# Altium schematic sheet USB.SchDoc
size A4
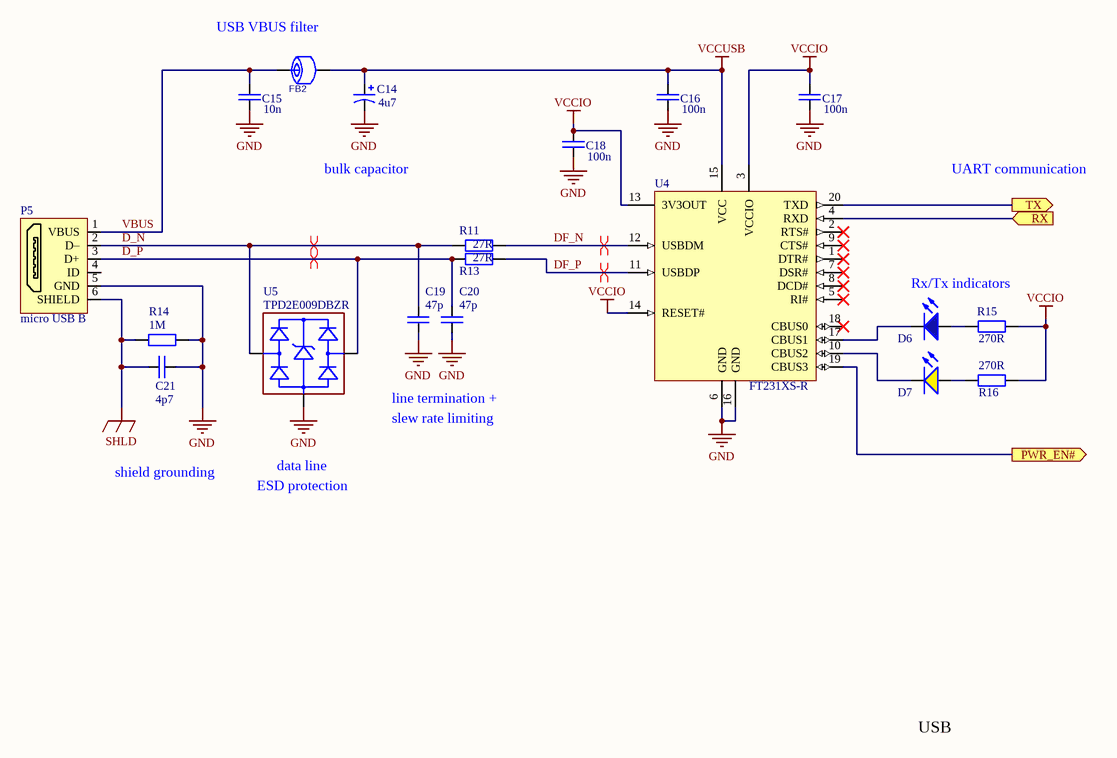
[diagram p0: USB.SchDoc]

## Parts
C14  value 4u7  [Tantalum Case A]  (hidden comment: comment)
C15  value 10n  [C_0805]  (hidden comment: comment)
C16  value 100n  [C_0805]  (hidden comment: comment)
C17  value 100n  [C_0805]  (hidden comment: comment)
C18  value 100n  [C_0805]  (hidden comment: comment)
C19  value 47p  [C_0805]  (hidden comment: comment)
C20  value 47p  [C_0805]  (hidden comment: comment)
C21  value 4p7  [C_0805]  (hidden comment: comment)
D6  comment  [LED_0805]  (value not drawn)
D7  LED Yellow  [LED_0805]  (value not drawn)
FB2  value  [SMD_0805]  (value not drawn)
P5  micro USB B  [micro-USB-HRS-ZX62D-B-5PA8]
R11  value 27R  [R_0805]  (hidden comment: comment)
R13  value 27R  [R_0805]  (hidden comment: comment)
R14  value 1M  [R_0805]  (hidden comment: comment)
R15  value 270R  [R_0805]  (hidden comment: comment)
R16  value 270R  [R_0805]  (hidden comment: comment)
U4  FT231XS-R  [SSOP-20]
U5  TPD2E009DBZR  [SOT23-3]

## Ports
PWR_EN# (out), RX (in), TX (out)

## Nets
GND: C14.2 C15.2 C16.2 C17.2 C18.2 C19.2 C20.2 C21.2 P5.5(GND) R14.1 U4.6(GND) U4.16(GND) U5.3(GND)
SHLD: C21.1 P5.6(SHIELD) R14.2
VCCIO: C17.1 C18.1 R15.2 R16.2 U4.3(VCCIO) U4.13(3V3OUT) U4.14(RESET#)
VCCUSB: C14.1 C16.1 FB2.2 U4.15(VCC)
D_N: C19.1 P5.2(D–) R11.1 U5.2(D-)
D_P: C20.1 P5.3(D+) R13.1 U5.1(D+)
DF_N: R11.2 U4.12(USBDM)
DF_P: R13.2 U4.11(USBDP)
PWR_EN#: U4.19(CBUS3) ; port PWR_EN#
RX: U4.4(RXD) ; port RX
TX: U4.20(TXD) ; port TX
VBUS: C15.1 FB2.1 P5.1(VBUS)
NetD6_1: D6.1(-) U4.17(CBUS1)
NetD6_2: D6.2(+) R15.1
NetD7_1: D7.1(-) U4.10(CBUS2)
NetD7_2: D7.2(+) R16.1

Not connected (* = marked no-connect by the designer): P5 4(ID); U4 1(DTR#)* 2(RTS#)* 5(RI#)* 7(DSR#)* 8(DCD#)* 9(CTS#)* 18(CBUS0)*

## Layout directives
differential pair: D_N, D_P, DF_N, DF_P

## Notes on the sheet
- (near FB2) USB VBUS filter
- bulk capacitor
- UART communication
- Rx/Tx indicators
- data line
- line termination +
- (near U5) slew rate limiting
- shield grounding
- ESD protection
- USB

## Library data of the parts
C14 = Capacitor - polarized: Generic polarized capacitor
C15-C21 = Capacitor: Generic capacitor
D6 = LED Blue
FB2 = Ferrite bead: Generic ferrite bead; Value: value
P5 = ZX62D-B-5PA8(30): USB Connector, Micro USB Type B, USB 2.0, Receptacle, 5 Ways, Surface Mount, Through Hole Mount; pin to pad: 6>0; Manufacturer: Hirose; Supplier 1: Farnell; ComponentLink1URL: http://www.farnell.com/datasheets/1693470.pdf; ComponentLink1Description: http://www.farnell.com/datasheets/1693470.pdf; Supplier Part Number 1: 2300438; HelpURL: https://www.farnell.com/datasheets/2691174.pdf; Manufacturer part number: ZX62D-B-5PA8(30)
R11 R13-R16 = Resistor: Generic resistor
U4 = FT231XS-R: USB to Full-Handshake UART Interface Chip, UHCI/OHCI/EHCI Compatible, USB 2.0 Compatible, -40 to +85 degC, 20-Pin SSOP, Pb-Free, Tape and Reel; Manufacturer: FTDI; DatasheetVersion: ver 1.2, Feb-2013; PackageVersion: Feb-13; PackageReference: SSOP-20; PackageDescription: 20-Pin Small Outline Package, 8.6 x 3.9 mm Body, 0.635 mm Pitch; Code_JEDEC: MO-137-AD; PartNumber: FT231XS-R; ComponentLink1Description: Manufacturer URL; ComponentLink1URL: http://www.ftdichip.com/; ComponentLink2Description: Datasheet; ComponentLink2URL: http://www.ftdichip.com/Support/Documents/DataSheets/ICs/DS_FT231X.pdf; ComponentLink3Description: FT231X Product Page; ComponentLink3URL: www.ftdichip.com/Products/ICs/FT231X.html; HelpURL: https://www.farnell.com/datasheets/1913754.pdf
U5 = TPD2E009DBZR: ESD protection for high-speed interfaces; Manufacturer: Texas Instruments; Dealer number: 595-TPD2E009DBZR; Dealer: Mouser; Category: diode array; Price: 0.174; Manufacturer Number: TPD2E009DBZR; Technology: SMT; HelpURL: http://www.ti.com/general/docs/suppproductinfo.tsp?distId=26&gotoUrl=http%3A%2F%2Fwww.ti.com%2Flit%2Fgpn%2Ftpd2e009